# Altium schematic sheet 200_DC-DC.SchDoc: DC-DC Convertion stages
size A3; Date: XXXXXX; DrawnBy: C.A.Cuaspa; Revision: V1R0; SheetNumber: 3; SheetTotal: 3
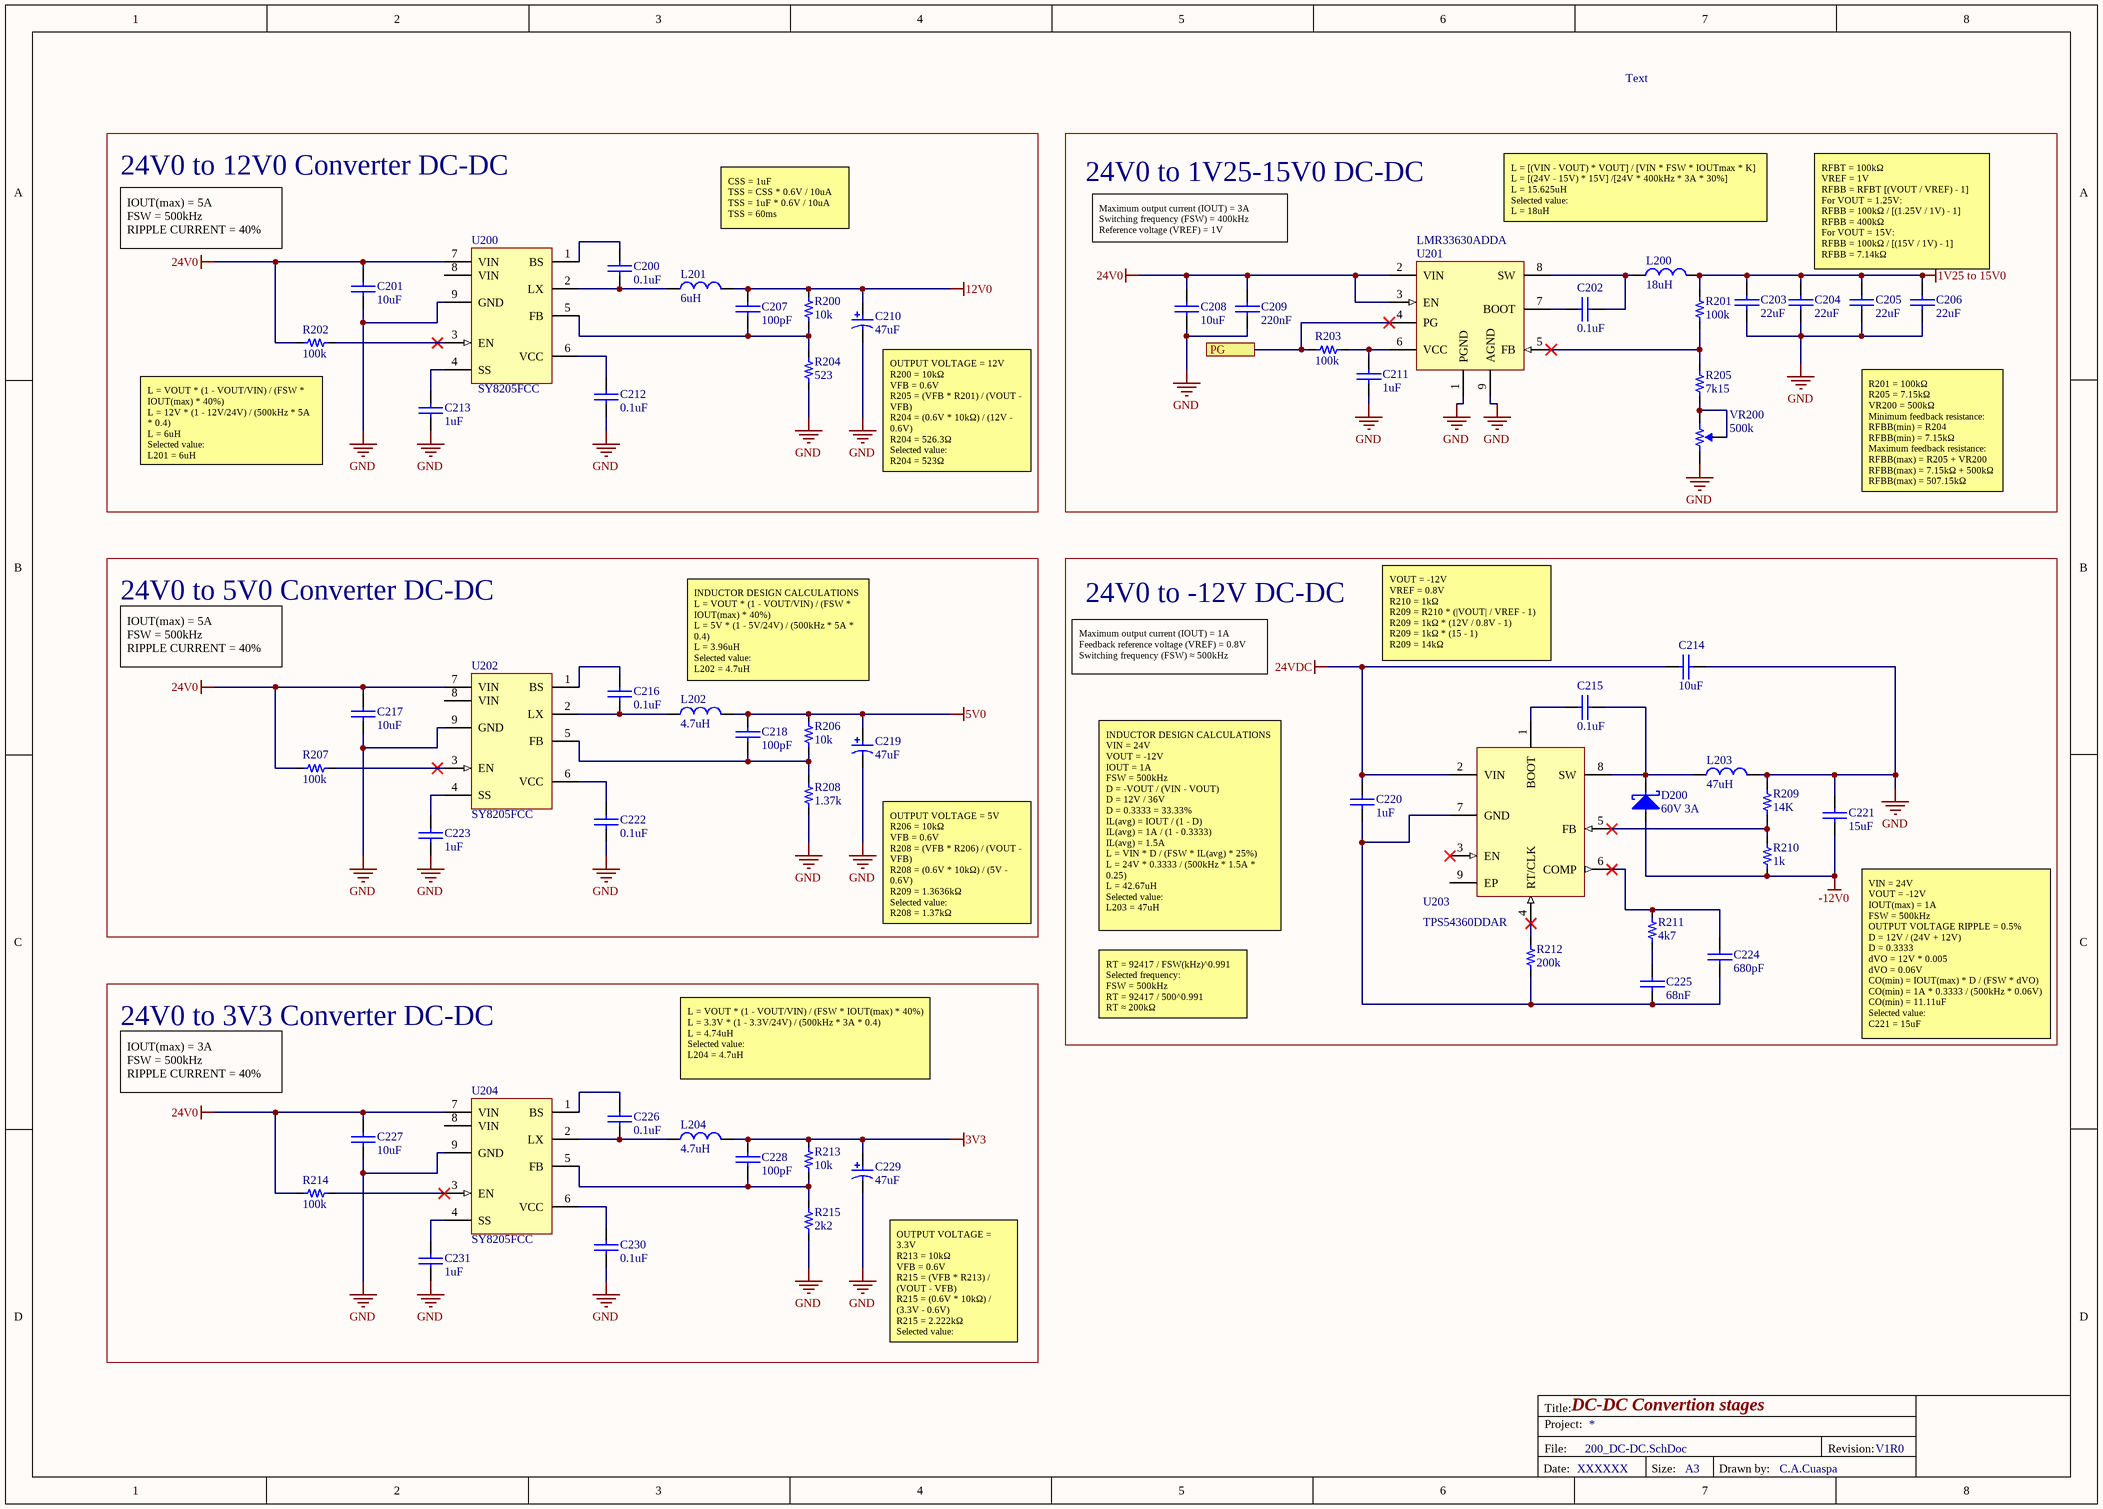
[diagram p0: 200_DC-DC.SchDoc]

## Parts
C200  value 0.1uF  [0603]  (hidden comment: 100nF 25V)
C201  value 10uF  [1206]  (hidden comment: 10uF 50V)
C202  value 0.1uF  [0805]  (hidden comment: 0.1uF 50V)
C203  value 22uF  [1210]  (hidden comment: 22uF 25V)
C204  value 22uF  [1210]  (hidden comment: 22uF 25V)
C205  value 22uF  [1210]  (hidden comment: 22uF 25V)
C206  value 22uF  [1210]  (hidden comment: 22uF 25V)
C207  value 100pF  [0402]  (hidden comment: 100pF 50V)
C208  value 10uF  [0603]  (hidden comment: 10uF 25V)
C209  value 220nF  [Cap_220nF_0603_50V]  (hidden comment: 220nF_50V)
C210  value 47uF  [RADIAL-CAN-SMD_Diax5mm_Hx6.1mm]  (hidden comment: 47uF 35V)
C211  value 1uF  [0603]  (hidden comment: 1uF 25V)
C212  value 0.1uF  [0603]  (hidden comment: 100nF 25V)
C213  value 1uF  [0805]  (hidden comment: 1uF 25V)
C214  value 10uF  [0805]  (hidden comment: 10uF 25V)
C215  value 0.1uF  [0402]  (hidden comment: 0.1uF 50V)
C216  value 0.1uF  [0603]  (hidden comment: 100nF 25V)
C217  value 10uF  [1206]  (hidden comment: 10uF 50V)
C218  value 100pF  [0402]  (hidden comment: 100pF 50V)
C219  value 47uF  [RADIAL-CAN-SMD_Diax5mm_Hx6.1mm]  (hidden comment: 47uF 35V)
C220  value 1uF  [0603]  (hidden comment: 1uF 25V)
C221  15uF  [Cap_15uF_2220_50V]
C222  value 0.1uF  [0603]  (hidden comment: 100nF 25V)
C223  value 1uF  [0805]  (hidden comment: 1uF 25V)
C224  value 680pF  [0603]  (hidden comment: 680pF 50V)
C225  value 68nF  [0603_1.4mm]  (hidden comment: 0.068uF 50V)
C226  value 0.1uF  [0603]  (hidden comment: 100nF 25V)
C227  value 10uF  [1206]  (hidden comment: 10uF 50V)
C228  value 100pF  [0402]  (hidden comment: 100pF 50V)
C229  value 47uF  [RADIAL-CAN-SMD_Diax5mm_Hx6.1mm]  (hidden comment: 47uF 35V)
C230  value 0.1uF  [0603]  (hidden comment: 100nF 25V)
C231  value 1uF  [0805]  (hidden comment: 1uF 25V)
D200  60V 3A  [DO_214AC]
L200  18uH  [Ind_18uH_7.5A_XR1265]
L201  value 6uH  [INDM130128X50N]  (hidden comment: 6uH_9.5A)
L202  value 4.7uH  [L_2SMD_8x8x4.5MM_NS]  (hidden comment: 4.7uH 6.3A)
L203  value 47uH  [L_2SMD_11.5x10X4MM]  (hidden comment: 47uH 3A)
L204  value 4.7uH  [L_2SMD_8x8x4.5MM_NS]  (hidden comment: 4.7uH 6.3A)
R200  value 10k  [0402]  (hidden comment: 10k 1/16W)
R201  value 100k  [0603]  (hidden comment: 100k 1/10W)
R202  value 100k  [0402]  (hidden comment: 100K 1/16W)
R203  value 100k  [0603]  (hidden comment: 100k 1/10W)
R204  value 523  [RESC3116X06N]  (hidden comment: C870783)
R205  value 7k15  [Res_7.15k_0603_1_10W]  (hidden comment: 7.15k)
R206  value 10k  [0402]  (hidden comment: 10k 1/16W)
R207  value 100k  [0402]  (hidden comment: 100K 1/16W)
R208  value 1.37k  [Res_1.37K_0402_0.1W]  (hidden comment: Res_1.37K_0402_0.1W)
R209  14k  [Res_14k_0603_1/10W]
R210  value 1k  [0805]  (hidden comment: 1k 1/8W)
R211  value 4k7  [0603]  (hidden comment: 4k7 1/10W)
R212  value 200k  [0603]  (hidden comment: 200k 1/10W)
R213  value 10k  [0402]  (hidden comment: 10k 1/16W)
R214  value 100k  [0402]  (hidden comment: 100K 1/16W)
R215  value 2k2  [0805]  (hidden comment: 2k2 1/8W)
U200  SY8205FCC  [SOIC127P600X140_HS-9N]
U201  LMR33630ADDA  [DCDC_ADJ_1.25V-15V_3A_ESOP-8]
U202  SY8205FCC  [SOIC127P600X140_HS-9N]
U203  TPS54360DDAR  [DCDC_INV_12V_1A_SOIC-8_EP]
U204  SY8205FCC  [SOIC127P600X140_HS-9N]
VR200  value 500k  [Pot_3x1_5mm_TH]  (hidden comment: 500k 1/5W)

## Blocks framed on the sheet
24V0 to 12V0 Converter DC-DC: C200 C201 C207 C210 C212 C213 L201 R200 R202 R204 U200
24V0 to 1V25-15V0 DC-DC: C202-C206 C208 C209 C211 L200 R201 R203 R205 U201 VR200
24V0 to 5V0 Converter DC-DC: C216-C219 C222 C223 L202 R206-R208 U202
24V0 to -12V DC-DC: C214 C215 C220 C221 C224 C225 D200 L203 R209-R212 U203
24V0 to 3V3 Converter DC-DC: C226-C231 L204 R213-R215 U204

## Ports
PG

## Nets
1V25 to 15V0: C203.1 C204.1 C205.1 C206.1 L200.2 R201.2
3V3: C228.1 C229.1 L204.2 R213.2
5V0: C218.1 C219.1 L202.2 R206.2
12V0: C207.1 C210.1 L201.2 R200.2
24V0: C201.1 C208.1 C209.1 C217.1 C227.1 R202.1 R207.1 R214.1 U200.7(VIN) U201.2(VIN) U201.3(EN) U202.7(VIN) U204.7(VIN)
24VDC: C214.1 C220.1 U203.2(VIN)
-12V0: C221.2 D200.2 R210.1
GND: C201.2 C203.2 C204.2 C205.2 C206.2 C208.2 C209.2 C210.2 C211.2 C212.2 C213.2 C214.2 C217.2 C219.2 C221.1 C222.2 C223.2 C227.2 C229.2 C230.2 C231.2 L203.2 R204.2 R208.1 R209.2 R215.1 U200.9(GND) U201.1(PGND) U201.9(AGND) U202.9(GND) U204.9(GND) VR200.3
PG: R203.1 U201.4(PG) ; port PG
NetC200_1: C200.1 U200.1(BS)
NetC200_2: C200.2 L201.1 U200.2(LX)
NetC202_1: C202.1 U201.7(BOOT)
NetC202_2: C202.2 L200.1 U201.8(SW)
NetC207_2: C207.2 R200.1 R204.1 U200.5(FB)
NetC211_1: C211.1 R203.2 U201.6(VCC)
NetC212_1: C212.1 U200.6(VCC)
NetC213_1: C213.1 U200.4(SS)
NetC215_1: C215.1 U203.1(BOOT)
NetC215_2: C215.2 D200.1 L203.1 U203.8(SW)
NetC216_1: C216.1 U202.1(BS)
NetC216_2: C216.2 L202.1 U202.2(LX)
NetC218_2: C218.2 R206.1 R208.2 U202.5(FB)
NetC220_2: C220.2 C224.2 C225.2 R212.1 U203.7(GND)
NetC222_1: C222.1 U202.6(VCC)
NetC223_1: C223.1 U202.4(SS)
NetC224_1: C224.1 R211.2 U203.6(COMP)
NetC225_1: C225.1 R211.1
NetC226_1: C226.1 U204.1(BS)
NetC226_2: C226.2 L204.1 U204.2(LX)
NetC228_2: C228.2 R213.1 R215.2 U204.5(FB)
NetC230_1: C230.1 U204.6(VCC)
NetC231_1: C231.1 U204.4(SS)
NetR201_1: R201.1 R205.2 U201.5(FB)
NetR202_2: R202.2 U200.3(EN)
NetR205_1: R205.1 VR200.1 VR200.2
NetR207_2: R207.2 U202.3(EN)
NetR209_1: R209.1 R210.2 U203.5(FB)
NetR212_2: R212.2 U203.4(RT/CLK)
NetR214_2: R214.2 U204.3(EN)

Not connected (* = marked no-connect by the designer): U200 8(VIN); U202 8(VIN); U203 3(EN)* 9(EP); U204 8(VIN)

## Notes on the sheet
- Text
- IOUT(max) = 5A
  FSW = 500kHz
  RIPPLE CURRENT = 40%
- CSS = 1uF
  TSS = CSS * 0.6V / 10uA
  TSS = 1uF * 0.6V / 10uA
  TSS = 60ms
- Maximum output current (IOUT) = 3A
  Switching frequency (FSW) = 400kHz
  Reference voltage (VREF) = 1V
- L = [(VIN - VOUT) * VOUT] / [VIN * FSW * IOUTmax * K]
  L = [(24V - 15V) * 15V] /[24V * 400kHz * 3A * 30%]
  L = 15.625uH
  Selected value:
  L = 18uH
- RFBT = 100kΩ
  VREF = 1V
  RFBB = RFBT [(VOUT / VREF) - 1]
  For VOUT = 1.25V:
  RFBB = 100kΩ / [(1.25V / 1V) - 1]
  RFBB = 400kΩ
  For VOUT = 15V:
  RFBB = 100kΩ / [(15V / 1V) - 1]
  RFBB = 7.14kΩ
- (near R202) L = VOUT * (1 - VOUT/VIN) / (FSW * IOUT(max) * 40%)
  L = 12V * (1 - 12V/24V) / (500kHz * 5A * 0.4)
  L = 6uH
  Selected value:
  L201 = 6uH
- (near C210) OUTPUT VOLTAGE = 12V
  R200 = 10kΩ
  VFB = 0.6V
  R205 = (VFB * R201) / (VOUT - VFB)
  R204 = (0.6V * 10kΩ) / (12V - 0.6V)
  R204 = 526.3Ω
  Selected value:
  R204 = 523Ω
- R201 = 100kΩ
  R205 = 7.15kΩ
  VR200 = 500kΩ
  Minimum feedback resistance:
  RFBB(min) = R204
  RFBB(min) = 7.15kΩ
  Maximum feedback resistance:
  RFBB(max) = R205 + VR200
  RFBB(max) = 7.15kΩ + 500kΩ
  RFBB(max) = 507.15kΩ
- INDUCTOR DESIGN CALCULATIONS
  L = VOUT * (1 - VOUT/VIN) / (FSW * IOUT(max) * 40%)
  L = 5V * (1 - 5V/24V) / (500kHz * 5A * 0.4)
  L = 3.96uH
  Selected value:
  L202 = 4.7uH
- Maximum output current (IOUT) = 1A
  Feedback reference voltage (VREF) = 0.8V
  Switching frequency (FSW) ≈ 500kHz
- VOUT = -12V
  VREF = 0.8V
  R210 = 1kΩ
  R209 = R210 * (|VOUT| / VREF - 1)
  R209 = 1kΩ * (12V / 0.8V - 1)
  R209 = 1kΩ * (15 - 1)
  R209 = 14kΩ
- OUTPUT VOLTAGE = 5V
  R206 = 10kΩ
  VFB = 0.6V
  R208 = (VFB * R206) / (VOUT - VFB)
  R208 = (0.6V * 10kΩ) / (5V - 0.6V)
  R209 = 1.3636kΩ
  Selected value:
  R208 = 1.37kΩ
- INDUCTOR DESIGN CALCULATIONS
  VIN = 24V
  VOUT = -12V
  IOUT = 1A
  FSW = 500kHz
  D = -VOUT / (VIN - VOUT)
  D = 12V / 36V
  D = 0.3333 = 33.33%
  IL(avg) = IOUT / (1 - D)
  IL(avg) = 1A / (1 - 0.3333)
  IL(avg) = 1.5A
  L = VIN * D / (FSW * IL(avg) * 25%)
  L = 24V * 0.3333 / (500kHz * 1.5A * 0.25)
  L = 42.67uH
  Selected value:
  L203 = 47uH
- RT = 92417 / FSW(kHz)^0.991
  Selected frequency:
  FSW = 500kHz
  RT = 92417 / 500^0.991
  RT ≈ 200kΩ
- VIN = 24V
  VOUT = -12V
  IOUT(max) = 1A
  FSW = 500kHz
  OUTPUT VOLTAGE RIPPLE = 0.5%
  D = 12V / (24V + 12V)
  D = 0.3333
  dVO = 12V * 0.005
  dVO = 0.06V
  CO(min) = IOUT(max) * D / (FSW * dVO)
  CO(min) = 1A * 0.3333 / (500kHz * 0.06V)
  CO(min) = 11.11uF
  Selected value:
  C221 = 15uF
- IOUT(max) = 3A
  FSW = 500kHz
  RIPPLE CURRENT = 40%
- L = VOUT * (1 - VOUT/VIN) / (FSW * IOUT(max) * 40%)
  L = 3.3V * (1 - 3.3V/24V) / (500kHz * 3A * 0.4)
  L = 4.74uH
  Selected value:
  L204 = 4.7uH
- (near C229) OUTPUT VOLTAGE = 3.3V
  R213 = 10kΩ
  VFB = 0.6V
  R215 = (VFB * R213) / (VOUT - VFB)
  R215 = (0.6V * 10kΩ) / (3.3V - 0.6V)
  R215 = 2.222kΩ
  Selected value:
  R215 = 2.2kΩ
- Title:
- Project:
- File:
- Revision:
- Date:
- Size:
- A3
- Drawn by:

## Library data of the parts
C200 C212 C216 C222 C226 C230 = Cap_0.1uF_0603_25V: CAP CER 0.1UF 25V X7R 0603; Manufacturer: TDK; Manufacturer Part Number: CGA3E2X7R1E104K080AA; Last modified by: J.Jaramillo; Last modified date: 20240309; ComponentLink1Description: Digi-key; ComponentLink1URL: https://www.digikey.com/en/products/detail/tdk-corporation/CGA3E2X7R1E104K080AA/2443145?s=N4IgTCBcDaIMIHECCBmAomAGgdgEoEY18AGAFgGliAOYpJEAXQF8g; Supplier 1: Digi-Key; Supplier Part Number 1: 445-5667-1-ND
C201 C217 C227 = Cap_10uF_1206_50V: CAP CER 10UF 50V X5R 1206; Manufacturer: Murata Electronics North America; Manufacturer Part Number: GRT31CR61H106ME01L; Last modified by: J.Jaramillo; Last modified date: 20240309; ComponentLink1Description: Digi-Key; ComponentLink1URL: https://www.digikey.com/product-detail/en/murata-electronics-north-america/GRT31CR61H106ME01L/490-12457-1-ND/5417158; Supplier 1: Digi-Key; Supplier Part Number 1: 490-12457-1-ND
C202 = Cap_0.1uF_0805_50V: CAP CER 0.1UF 50V X7R 0805; Manufacturer: Yageo; Manufacturer Part Number: CC0805JRX7R9BB104; Supplier 1: Digi-Key; Supplier Part Number 1: 311-1858-1-ND; Last modified by: J.Jaramillo; Last modified date: 20240309; ComponentLink1Description: Digi-Key; ComponentLink1URL: https://www.digikey.com/product-detail/en/yageo/CC0805JRX7R9BB104/311-1858-1-ND/5195760
C203-C206 = Cap_22uF_1210_25V: CAP CER 22UF 25V X5R 1210; Manufacturer: KYOCERA AVX; Manufacturer Part Number: 12103D226KAT2A; Supplier 1: Digi-Key; Supplier Part Number 1: 478-5999-1-ND; Last modified by: J.Jaramillo; Last modified date: 20240309; ComponentLink1Description: Digi-Key; ComponentLink1URL: https://www.digikey.com/en/products/detail/kyocera-avx/12103D226KAT2A/2208898?s=N4IgTCBcDaIIxjgBgMwBExgGwGkCCAKmHiALoC%2BQA
C207 C218 C228 = Cap_100pF_0402_50V: CAP CER 100PF 50V X7R 0402; Manufacturer: Wurth Electronics Inc.; Manufacturer Part Number: 885012205055; Supplier 1: Digi-Key; Supplier Part Number 1: 732-7550-1-ND; Reel stock: N/A; Last modified by: J.Jaramillo; Last modified date: 20240309; ComponentLink1Description: Digi-key; ComponentLink1URL: https://www.digikey.com/product-detail/en/wurth-electronics-inc/885012205055/732-7550-1-ND/5454177
C208 = Cap_10uF_0603_25V: CAP CER 10UF 25V X5R 0603; Manufacturer: Murata Electronics; Manufacturer Part Number: GRT188R61E106ME13D; Supplier 1: Digi-Key; Supplier Part Number 1: 490-12323-1-ND; Last modified by: J.Jaramillo; Last modified date: 20240309; ComponentLink1Description: Digi-Key; ComponentLink1URL: https://www.digikey.com/en/products/detail/murata-electronics/GRT188R61E106ME13D/5416745
C209 = Cap_220nF_0603_50V: CAP CER 220nF 50V X7R 0603; Manufacturer: YAGEO; Manufacturer Part Number: CS0603KRX7R9BB224; Supplier 1: LCSC; Supplier Part Number 1: C1882480; Reel stock: N/A; Last modified by: C.A.Cuaspa; Last modified date: 20261104; ComponentLink1Description: LCSC; ComponentLink1URL: https://www.lcsc.com/es/product-detail/C1882480.html?s_z=n_q_CS0603KRX7R9BB224; ComponentLink2Description: DATASHEET; ComponentLink2URL: https://www.lcsc.com/datasheet/C1882480.pdf
C210 C219 C229 = Cap_47uF_35V_ALU_SMD: CAP ALUM 47UF 20% 35V SMD; Manufacturer: Panasonic Electronic Components; Manufacturer Part Number: EEEFT1V470AR; Last modified by: J.Jaramillo; Last modified date: 20240309; ComponentLink1Description: Digi-Key; ComponentLink1URL: https://www.digikey.com/product-detail/en/panasonic-electronic-components/EEE-FT1V470AR/PCE5014CT-ND/2652069; Supplier 1: Digi-Key; Supplier Part Number 1: PCE5014CT-ND
C211 C220 = Cap_1uF_0603_25V: CAP CER 1UF 25V X7R 0603; Manufacturer: Samsung Electro-Mechanics; Manufacturer Part Number: CL10B105KA8VPNC; Supplier 1: Digi-Key; Supplier Part Number 1: 1276-6617-1-ND; Last modified by: J.Jaramillo; Last modified date: 20240309; ComponentLink1Description: Digi-Key; ComponentLink1URL: https://www.digikey.com/en/products/detail/samsung-electro-mechanics/CL10B105KA8VPNC/5961101?s=N4IgTCBcDaIIxgOwDYC0zl0auqByAIiALoC%2BQA
C213 C223 C231 = Cap_1uF_0805_25V: CAP CER 1UF 25V X7R 0805; Manufacturer: Yageo; Manufacturer Part Number: CC0805KKX7R8BB105; Supplier 1: Digi-Key; Supplier Part Number 1: 311-1456-1-ND; Last modified by: J.Jaramillo; Last modified date: 20240309; ComponentLink1Description: Digi-Key; ComponentLink1URL: https://www.digikey.com/product-detail/en/yageo/CC0805KKX7R8BB105/311-1456-1-ND/2833762
C214 = Cap_10uF_0805_25V: CAP CER 10UF 25V X5R 0805; Manufacturer: Yageo; Manufacturer Part Number: CC0805KKX5R8BB106; Supplier 1: Digi-Key; Supplier Part Number 1: 311-1869-1-ND; Last modified by: J.Jaramillo; Last modified date: 20240309; ComponentLink1Description: Digi-Key; ComponentLink1URL: https://www.digikey.com/product-detail/en/yageo/CC0805KKX5R8BB106/311-1869-1-ND/5195771
C215 = Cap_0.1uF_0402_50V: CAP CER 0.1UF 50V X7R 0402; Manufacturer: Samsung Electro-Mechanics; Manufacturer Part Number: CL05B104KB54PNC; Supplier 1: Digi-Key; Supplier Part Number 1: 1276-CL05B104KB54PNCCT-ND; Last modified by: J.Jaramillo; Last modified date: 20240309; ComponentLink1Description: Digi-Key; ComponentLink1URL: https://www.digikey.com/en/products/detail/samsung-electro-mechanics/CL05B104KB54PNC/11487801?s=N4IgTCBcDaIMIBkAMBWAQgRiQFgNJpWwAUA5OEAXQF8g
C221 = Cap_15uF_2220_50V: CAP CER 15uF 50V X7R 2220; Manufacturer: PSA; Manufacturer Part Number: FS55X156K500EHG; Supplier 1: LCSC; Supplier Part Number 1: C2936139; Reel stock: N/A; Last modified by: C.A.Cuaspa; Last modified date: 20261104; ComponentLink1Description: LCSC; ComponentLink1URL: https://www.lcsc.com/es/product-detail/C2936139.html?s_z=n_q_t_capacitor%252015uF; ComponentLink2Description: DATASHEET; ComponentLink2URL: https://www.lcsc.com/datasheet/C2936139.pdf; Value: 15uF
C224 = Cap_680pF_0603_50V: CAP CER 680PF 50V X7R 0603; Manufacturer: KEMET; Manufacturer Part Number: C0603C681K5RAC7867; Supplier 1: Digi-Key; Supplier Part Number 1: 399-C0603C681K5RAC7867CT-ND; Last modified by: J.Jaramillo; Last modified date: 20240309; ComponentLink1Description: Digi-Key; ComponentLink1URL: https://www.digikey.com/en/products/detail/kemet/C0603C681K5RAC7867/411079
C225 = Cap_0.068uF_0603_50V: CAP CER 0.068UF 50V X7R 0603; Manufacturer: Samsung Electro-Mechanics; Manufacturer Part Number: CL10B683KB8NNNC; Reel stock: N/A; Last modified by: J.Jaramillo; Last modified date: 20240309; ComponentLink1Description: Digi-key; ComponentLink1URL: https://www.digikey.com/product-detail/en/samsung-electro-mechanics/CL10B683KB8NNNC/1276-1814-1-ND/3889900; Supplier 1: Digi-Key; Supplier Part Number 1: 1276-1814-1-ND
D200 = D_Schottky_60V_3A_DO_214AC: DIODE SCHOTTKY 60V 3A DO214AC; Manufacturer: Taiwan Semiconductor Corporation; Manufacturer Part Number: TSSA3U60 R3G; Reel Stock: N/A; Last modified by: J.Jaramillo; Last modified date: 20240310; Supplier 1: Digi-Key; Supplier Part Number 1: TSSA3U60R3GCT-ND; ComponentLink1Description: Digi-Key; ComponentLink1URL: https://www.digikey.com/products/en?keywords=TSSA3U60R3GCT-ND
L200 = Ind_18uH_7.5A_XR1265: FIXED IND 18uH 7.5A 35mΩ SMD,13.5x12.6mm; Manufacturer: XR; Manufacturer Part Number: XR1265-180M; Supplier 1: LCSC; Supplier Part Number 1: C5339469; Reel Stock: N/A; Last modified by: C.A.Cuaspa; Last modified date: 20261104; ComponentLink1Description: LCSC; ComponentLink1URL: https://www.lcsc.com/es/product-detail/C5339469.html?s_z=n_q_XR1265-180M; ComponentLink2Description: DATASHEET; ComponentLink2URL: https://www.lcsc.com/datasheet/C5339469.pdf; Value: 18uH
L201 = L_6uH_9.5A_SMD,13x12.8mm: 9.5A 6uH ±20% 11.5A 14.85mΩ Molded inductor SMD,13x12.8mm Fixed Inductors; Manufacturer: Coilank; Manufacturer Part Number: APZBX1250M6R0; Supplier 1: LCSC; Supplier Part Number 1: C54623474; Reel Stock: N/A; Last modified by: C.A.Cuaspa; Last modified date: 20261027; ComponentLink1Description: LCSC; ComponentLink1URL: https://www.lcsc.com/es/product-detail/C54623474.html?s_z=n_q_inductor%25206uH; ComponentLink2Description: Datasheet; ComponentLink2URL: https://www.lcsc.com/datasheet/C54623474.pdf
L202 L204 = L_4.7uH_6.3A_NS: FIXED IND 4.7UH 6.3A 18 MOHM SMD; Manufacturer: Murata Electronics; Manufacturer Part Number: 1217AS-H-4R7N=P3; Supplier 1: Digi-Key; Supplier Part Number 1: 490-10791-1-ND; Reel Stock: N/A; Last modified by: J.Jaramillo; Last modified date: 20240310; ComponentLink1Description: Digi-Key; ComponentLink1URL: https://www.digikey.com/en/products/detail/murata-electronics/1217AS-H-4R7N-P3/5271432
L203 = L_47uH_3A_SMD_11.5x10MM: 3A 47uH 4,5A 155mÎ© Â±20% SMD,11,5x10mm Fixed Inductors RoHS; Manufacturer: Shun Xiang Nuo; Manufacturer Part Number: SMMS1040-470M; Supplier 1: LCSC; Supplier Part Number 1: C149599; Reel Stock: N/A; Last modified by: J.Jaramillo; Last modified date: 270326; ComponentLink1Description: Datasheet; ComponentLink1URL: https://www.lcsc.com/datasheet/C149599.pdf; ComponentLink2Description: LCSC; ComponentLink2URL: https://www.lcsc.com/product-detail/C149599.html
R200 R206 R213 = Res_10k_0402_1/16W: RES SMD 10K OHM 1% 1/16W 0402; Manufacturer: Yageo; Manufacturer Part Number: RC0402FR-0710KL; Supplier 1: Digi-Key; Supplier Part Number 1: 311-10.0KLRCT-ND; Reel Stock: N/A; Last modified by: J.Jaramillo; Last modified date: 20240310; ComponentLink1Description: Digi-Key; ComponentLink1URL: https://www.digikey.com/en/products/detail/yageo/RC0402FR-0710KL/726523?s=N4IgTCBcDaIEoGEAMAWJYBicC0SDsAjEgNIAyIAugL5A
R201 R203 = Res_100k_0603_1/10W: RES 100k OHM 1% 1/10W 0603; Manufacturer: Stackpole Electronics Inc.; Manufacturer Part Number: RMCF0603FT100K; Supplier 1: Digi-Key; Supplier Part Number 1: RMCF0603FT100KCT-ND; Reel Stock: N/A; Last modified by: J.Jaramillo; Last modified date: 20240310; ComponentLink1Description: Digi-Key; ComponentLink1URL: https://www.digikey.com/product-detail/en/stackpole-electronics-inc/RMCF0603FT100K/RMCF0603FT100KCT-ND/1943118
R202 R207 R214 = Res_100k_0402_1/16W: RES SMD 100K OHM 1% 1/16W 0402; Manufacturer: Yageo; Manufacturer Part Number: RC0402FR-07100KL; Supplier 1: Digi-Key; Supplier Part Number 1: 311-100KLRCT-ND; Reel Stock: N/A; Last modified by: J.Jaramillo; Last modified date: 20240310; ComponentLink1Description: Digi-Key; ComponentLink1URL: https://www.digikey.com/en/products/detail/yageo/RC0402FR-07100KL/726526?s=N4IgTCBcDaIEoGEAMAWJYBicC0SDsAjEkgNIAyIAugL5A
R204 = Res_523_1206_0.25W: RES 523Ω ±0.1% 250mW 1206; Manufacturer: YAGEO; Manufacturer Part Number: RT1206BRD07523RL; Supplier 1: LCSC; Supplier Part Number 1: C870783; Reel Stock: N/A; Last modified by: C.A.Cuaspa; Last modified date: 20261027; ComponentLink1Description: LCSC; ComponentLink1URL: https://www.lcsc.com/es/product-detail/C870783.html?s_z=n_q_t_resistor%2520523%2520; ComponentLink2Description: Datasheet; ComponentLink2URL: https://www.lcsc.com/datasheet/C870783.pdf
R205 = Res_7.15k_0603_1_10W: RES SMD 7.15K OHM 0.1% 100mW 0603; Manufacturer: YAGEO; Manufacturer Part Number: RT0603BRD077K15L; Supplier 1: LCSC; Supplier Part Number 1: C861562; Reel Stock: N/A; Last modified by: C.A.Cuaspa; Last modified date: 20261104; ComponentLink1Description: LCSC; ComponentLink1URL: https://www.lcsc.com/es/product-detail/C861562.html?s_z=n_q_RT0603BRD077K15L; ComponentLink2Description: DATASHEET; ComponentLink2URL: https://www.lcsc.com/datasheet/C861562.pdf
R208 = Res_1.37K_0402_0.1W: RES 1.37kΩ ±1% 100mW 0402; Manufacturer: PANASONIC; Manufacturer Part Number: ERJ2RKF1371X; Supplier 1: LCSC; Supplier Part Number 1: C3025701; Reel Stock: N/A; Last modified by: C.A.Cuaspa; Last modified date: 20261028; ComponentLink1Description: LCSC; ComponentLink1URL: https://www.lcsc.com/es/product-detail/C3025701.html?s_z=n_q_t_resistor%25201.37K&spm=wm.fly.bg.5.xh___wm.ssy.tc.0.tz&lcsc_vid=QFZYVlcFRFBZAlcDFVQLVVBXQlJZV1IFTlhYAQVfQlcxVlNfRVleX1FeRFFaUTsOAxUeFF5JWBYZEEoKFBINSQcJGk4LFEsFFhULAAsUDk5fVlxXWQkaCgg%3D; ComponentLink2Description: Datasheet; ComponentLink2URL: https://www.lcsc.com/datasheet/C3025701.pdf?spm=wm.sxq.inf.ggs___wm.fly.bg.5.xh&lcsc_vid=QFZYVlcFRFBZAlcDFVQLVVBXQlJZV1IFTlhYAQVfQlcxVlNfRVleX1FeRFFaUTsOAxUeFF5JWBYZEEoKFBINSQcJGk4LFEsFFhULAAsUDk5fVlxXWQkaCgg%3D
R209 = Res_14k_0603_1/10W: RES 14kΩ ±1% 100mW 0603; Manufacturer: YAGEO; Manufacturer Part Number: RC0603FR-0714KL; Supplier 1: LCSC; Supplier Part Number 1: C137795; Reel Stock: N/A; Last modified by: C.A.Cuaspa; Last modified date: 20261104; ComponentLink1Description: LCSC; ComponentLink1URL: https://www.lcsc.com/es/product-detail/C137795.html?s_z=n_q_RC0603FR-0714KL; ComponentLink2Description: DATASHEET; ComponentLink2URL: https://www.lcsc.com/datasheet/C137795.pdf; Value: 14K
R210 = Res_1k_0805_1/8W: RES SMD 1K OHM 1% 1/8W 0805; Manufacturer Part Number: RC0805FR-071KL; Manufacturer: Yageo; Reel Stock: N/A; Last modified by: J.Jaramillo; Last modified date: 20240310; ComponentLink1Description: Digi-Key; ComponentLink1URL: https://www.digikey.com/en/products/detail/yageo/RC0805FR-071KL/727444?s=N4IgTCBcDaIEoGEAMAOJBWAYnAtEg7AIwDSAMiALoC%2BQA; Supplier 1: Digi-Key; Supplier Part Number 1: 311-1.00KCRCT-ND
R211 = Res_4k7_0603_1/10W: RES SMD 4.7K OHM 1% 1/10W 0603; Manufacturer: Yageo; Manufacturer Part Number: RC0603FR-074K7L; Supplier 1: Digi-Key; Supplier Part Number 1: 311-4.70KHRCT-ND; Reel Stock: N/A; Last modified by: J.Jaramillo; Last modified date: 20240310; ComponentLink1Description: Digi-Key; ComponentLink1URL: https://www.digikey.com/product-detail/en/yageo/RC0603FR-074K7L/311-4-70KHRCT-ND/730159
R212 = Res_200k_0603_1/10W: RES 200K OHM 1% 1/10W 0603; Manufacturer: Stackpole Electronics Inc; Manufacturer Part Number: RMCF0603FT200K; Supplier 1: Digi-Key; Supplier Part Number 1: RMCF0603FT200KCT-ND; Reel Stock: N/A; Last modified by: J.Jaramillo; Last modified date: 20240310; ComponentLink1Description: Digi-Key; ComponentLink1URL: https://www.digikey.com/en/products/detail/stackpole-electronics-inc/RMCF0603FT200K/1760715
R215 = Res_2k2_0805_1/8W: RES SMD 2.2K OHM 1% 1/8W 0805; Manufacturer Part Number: RC0805FR-072K2L; Manufacturer: Yageo; Reel Stock: N/A; Last modified by: J.Jaramillo; Last modified date: 20240310; ComponentLink1Description: Digi-Key; ComponentLink1URL: https://www.digikey.com/product-detail/en/yageo/RC0805FR-072K2L/311-2.20KCRCT-ND/730623; Supplier 1: Digi-Key; Supplier Part Number 1: 311-2.20KCRCT-ND
U200 U202 U204 = DCDC_ADJ_5A_SOIC_8-EP: High Efficiency Fast Response, 5A, 30V Input Synchronous Step Down Regulator; Manufacturer: Silergy; Manufacturer Part Number: SY8205FCC; Supplier 1: LCSC; Supplier Part Number 1: C111875; Reel Stock: N/A; Last modified by: C.A.Cuaspa; Last modified date: 20261027
  U200: ComponentLink1Description: LCSC; ComponentLink1URL: https://www.lcsc.com/es/product-detail/C111875.html?s_z=n_q_SY8205FCC; ComponentLink2Description: DATASHEET; ComponentLink2URL: https://www.lcsc.com/datasheet/C111875.pdf
U201 = DCDC_ADJ_1.25V-15V_3A_ESOP-8: 3.8V to 36V, 3A synchronous step-down converter; Manufacturer: TI; Manufacturer Part Number: LMR33630ADDA; Supplier 1: LCSC; Supplier Part Number 1: ESOP-8; Reel Stock: N/A; Last modified by: C.A.Cuaspa; Last modified date: 20261104; ComponentLink1Description: LCSC; ComponentLink1URL: https://www.lcsc.com/es/product-detail/C2866787.html?s_z=n_q_t_lmr33630; ComponentLink2Description: DATASHEET; ComponentLink2URL: https://www.lcsc.com/datasheet/C2866787.pdf
U203 = DCDC_INV_12V_1A_SOIC-8_EP: 60V Input, 3.5A Output Step-Down DC-DC Converter; Manufacturer: TI; Manufacturer Part Number: TPS54360DDAR; Supplier 1: LCSC; Supplier Part Number 1: C44377; Reel Stock: N/A; Last modified by: C.A.Cuaspa; Last modified date: 20261104; ComponentLink1Description: LCSC; ComponentLink1URL: https://www.lcsc.com/es/product-detail/C44377.html?s_z=n_q_TPS54360DDAR; ComponentLink2Description: DATASHEET; ComponentLink2URL: https://www.lcsc.com/datasheet/C44377.pdf
VR200 = Pot_500k_1/5W_TH: POT 500K OHM 1/5W PLASTIC LINEAR; Manufacturer: TT Electronics/BI; Manufacturer Part Number: P160KN-0QC15B500K; Reel Stock: N/A; Last modified by: J.Jaramillo; Last modified date: 20240310; ComponentLink1Description: Digi-key; ComponentLink1URL: https://www.digikey.com/products/en?keywords=987-1304-ND; Supplier 1: Digi-Key; Supplier Part Number 1: 987-1304-ND